# Altium schematic sheet Flash_memory.SchDoc: =DT_SCH_Title
size A3; Organization: Droid Technologies
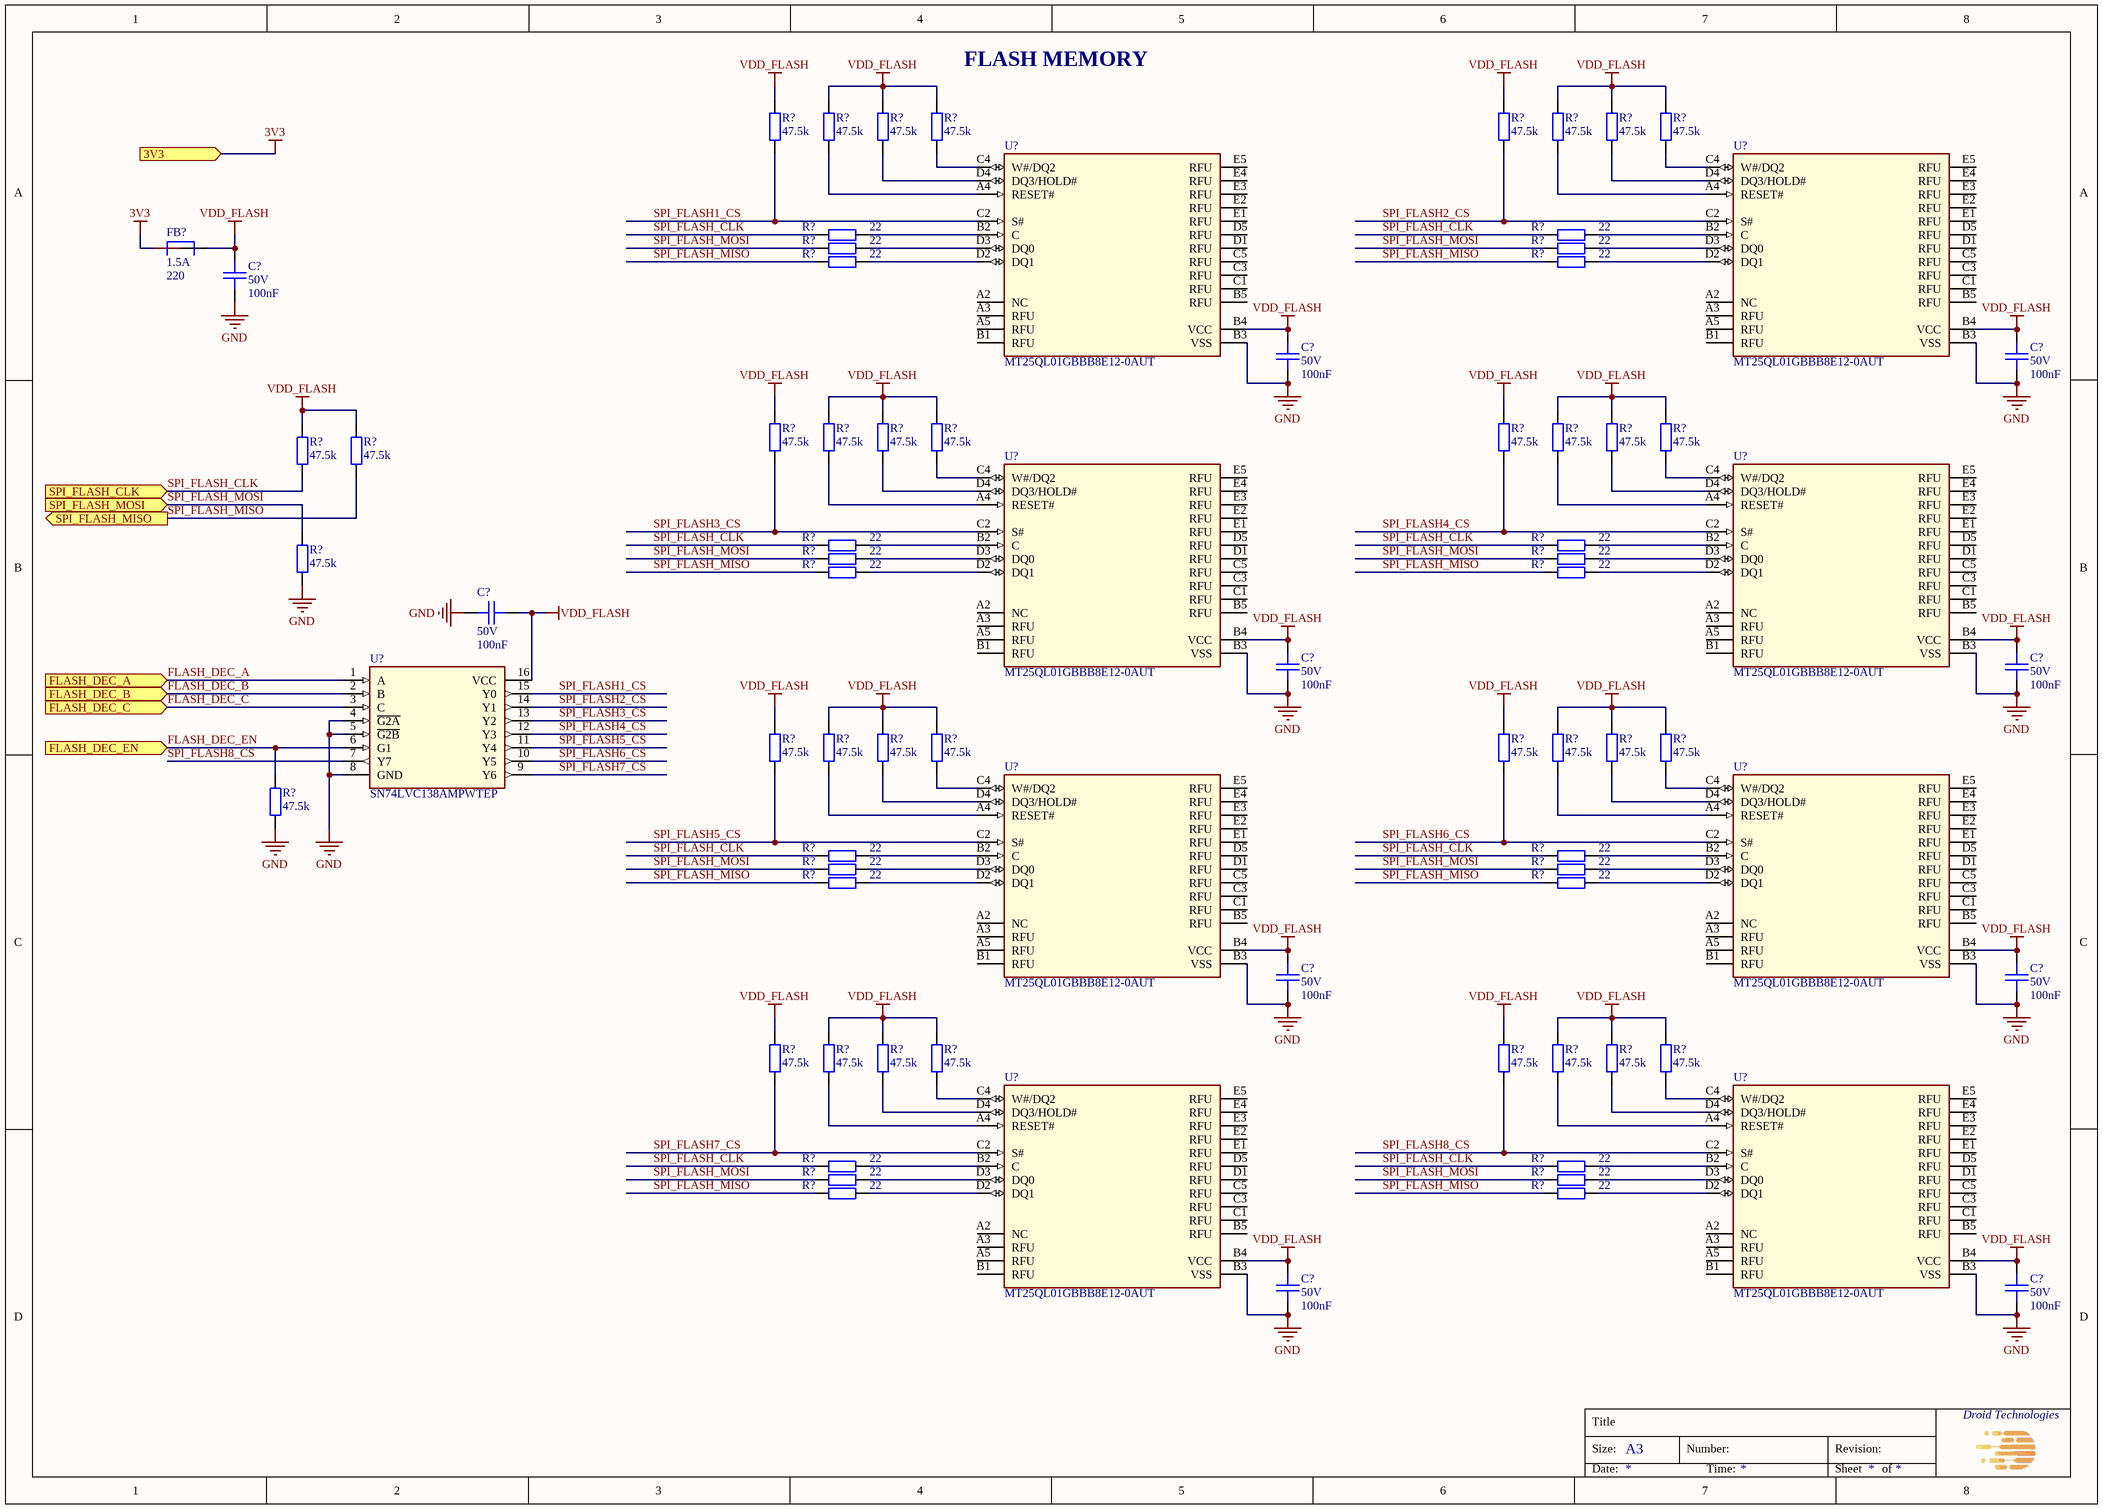
[diagram p0: Flash_memory.SchDoc]

## Parts
(Parts that share a designator on the sheet are numbered #1, #2 ... from top to bottom, then left to right.)
C?#1  Voltage Rating: 50V  Capacitance: 100nF  [CAPC100x50x50L25]  (hidden comment: GCM155L8EH104KE07D)
C?#2  Voltage Rating: 50V  Capacitance: 100nF  [CAPC100x50x50L25]  (hidden comment: GCM155L8EH104KE07D)
C?#3  Voltage Rating: 50V  Capacitance: 100nF  [CAPC100x50x50L25]  (hidden comment: GCM155L8EH104KE07D)
C?#4  Voltage Rating: 50V  Capacitance: 100nF  [CAPC100x50x50L25]  (hidden comment: GCM155L8EH104KE07D)
C?#5  Voltage Rating: 50V  Capacitance: 100nF  [CAPC100x50x50L25]  (hidden comment: GCM155L8EH104KE07D)
C?#6  Voltage Rating: 50V  Capacitance: 100nF  [CAPC100x50x50L25]  (hidden comment: GCM155L8EH104KE07D)
C?#7  Voltage Rating: 50V  Capacitance: 100nF  [CAPC100x50x50L25]  (hidden comment: GCM155L8EH104KE07D)
C?#8  Voltage Rating: 50V  Capacitance: 100nF  [CAPC100x50x50L25]  (hidden comment: GCM155L8EH104KE07D)
C?#9  Voltage Rating: 50V  Capacitance: 100nF  [CAPC100x50x50L25]  (hidden comment: GCM155L8EH104KE07D)
C?#10  Voltage Rating: 50V  Capacitance: 100nF  [CAPC100x50x50L25]  (hidden comment: GCM155L8EH104KE07D)
FB?  Imax: 1.5A  Impedance: 220  [BEADC160X80X95L40]  (hidden comment: BLM18KG221BH1D)
R?#1  Resistance: 47.5k  [RESC100X50X40L25]  (hidden comment: RC0402FR-0747K5L)
R?#2  Resistance: 47.5k  [RESC100X50X40L25]  (hidden comment: RC0402FR-0747K5L)
R?#3  Resistance: 47.5k  [RESC100X50X40L25]  (hidden comment: RC0402FR-0747K5L)
R?#4  Resistance: 47.5k  [RESC100X50X40L25]  (hidden comment: RC0402FR-0747K5L)
R?#5  Resistance: 47.5k  [RESC100X50X40L25]  (hidden comment: RC0402FR-0747K5L)
R?#6  Resistance: 47.5k  [RESC100X50X40L25]  (hidden comment: RC0402FR-0747K5L)
R?#7  Resistance: 47.5k  [RESC100X50X40L25]  (hidden comment: RC0402FR-0747K5L)
R?#8  Resistance: 47.5k  [RESC100X50X40L25]  (hidden comment: RC0402FR-0747K5L)
R?#9  Resistance: 22  [RESC100X50X40L25]  (hidden comment: RC0402FR-0722RL)
R?#10  Resistance: 22  [RESC100X50X40L25]  (hidden comment: RC0402FR-0722RL)
R?#11  Resistance: 22  [RESC100X50X40L25]  (hidden comment: RC0402FR-0722RL)
R?#12  Resistance: 22  [RESC100X50X40L25]  (hidden comment: RC0402FR-0722RL)
R?#13  Resistance: 22  [RESC100X50X40L25]  (hidden comment: RC0402FR-0722RL)
R?#14  Resistance: 22  [RESC100X50X40L25]  (hidden comment: RC0402FR-0722RL)
R?#15  Resistance: 47.5k  [RESC100X50X40L25]  (hidden comment: RC0402FR-0747K5L)
R?#16  Resistance: 47.5k  [RESC100X50X40L25]  (hidden comment: RC0402FR-0747K5L)
R?#17  Resistance: 47.5k  [RESC100X50X40L25]  (hidden comment: RC0402FR-0747K5L)
R?#18  Resistance: 47.5k  [RESC100X50X40L25]  (hidden comment: RC0402FR-0747K5L)
R?#19  Resistance: 47.5k  [RESC100X50X40L25]  (hidden comment: RC0402FR-0747K5L)
R?#20  Resistance: 47.5k  [RESC100X50X40L25]  (hidden comment: RC0402FR-0747K5L)
R?#21  Resistance: 47.5k  [RESC100X50X40L25]  (hidden comment: RC0402FR-0747K5L)
R?#22  Resistance: 47.5k  [RESC100X50X40L25]  (hidden comment: RC0402FR-0747K5L)
R?#23  Resistance: 47.5k  [RESC100X50X40L25]  (hidden comment: RC0402FR-0747K5L)
R?#24  Resistance: 47.5k  [RESC100X50X40L25]  (hidden comment: RC0402FR-0747K5L)
R?#25  Resistance: 22  [RESC100X50X40L25]  (hidden comment: RC0402FR-0722RL)
R?#26  Resistance: 22  [RESC100X50X40L25]  (hidden comment: RC0402FR-0722RL)
R?#27  Resistance: 22  [RESC100X50X40L25]  (hidden comment: RC0402FR-0722RL)
R?#28  Resistance: 22  [RESC100X50X40L25]  (hidden comment: RC0402FR-0722RL)
R?#29  Resistance: 22  [RESC100X50X40L25]  (hidden comment: RC0402FR-0722RL)
R?#30  Resistance: 22  [RESC100X50X40L25]  (hidden comment: RC0402FR-0722RL)
R?#31  Resistance: 47.5k  [RESC100X50X40L25]  (hidden comment: RC0402FR-0747K5L)
R?#32  Resistance: 47.5k  [RESC100X50X40L25]  (hidden comment: RC0402FR-0747K5L)
R?#33  Resistance: 47.5k  [RESC100X50X40L25]  (hidden comment: RC0402FR-0747K5L)
R?#34  Resistance: 47.5k  [RESC100X50X40L25]  (hidden comment: RC0402FR-0747K5L)
R?#35  Resistance: 47.5k  [RESC100X50X40L25]  (hidden comment: RC0402FR-0747K5L)
R?#36  Resistance: 47.5k  [RESC100X50X40L25]  (hidden comment: RC0402FR-0747K5L)
R?#37  Resistance: 47.5k  [RESC100X50X40L25]  (hidden comment: RC0402FR-0747K5L)
R?#38  Resistance: 47.5k  [RESC100X50X40L25]  (hidden comment: RC0402FR-0747K5L)
R?#39  Resistance: 47.5k  [RESC100X50X40L25]  (hidden comment: RC0402FR-0747K5L)
R?#40  Resistance: 47.5k  [RESC100X50X40L25]  (hidden comment: RC0402FR-0747K5L)
R?#41  Resistance: 22  [RESC100X50X40L25]  (hidden comment: RC0402FR-0722RL)
R?#42  Resistance: 22  [RESC100X50X40L25]  (hidden comment: RC0402FR-0722RL)
R?#43  Resistance: 22  [RESC100X50X40L25]  (hidden comment: RC0402FR-0722RL)
R?#44  Resistance: 22  [RESC100X50X40L25]  (hidden comment: RC0402FR-0722RL)
R?#45  Resistance: 22  [RESC100X50X40L25]  (hidden comment: RC0402FR-0722RL)
R?#46  Resistance: 22  [RESC100X50X40L25]  (hidden comment: RC0402FR-0722RL)
R?#47  Resistance: 47.5k  [RESC100X50X40L25]  (hidden comment: RC0402FR-0747K5L)
R?#48  Resistance: 47.5k  [RESC100X50X40L25]  (hidden comment: RC0402FR-0747K5L)
R?#49  Resistance: 47.5k  [RESC100X50X40L25]  (hidden comment: RC0402FR-0747K5L)
R?#50  Resistance: 47.5k  [RESC100X50X40L25]  (hidden comment: RC0402FR-0747K5L)
R?#51  Resistance: 47.5k  [RESC100X50X40L25]  (hidden comment: RC0402FR-0747K5L)
R?#52  Resistance: 47.5k  [RESC100X50X40L25]  (hidden comment: RC0402FR-0747K5L)
R?#53  Resistance: 47.5k  [RESC100X50X40L25]  (hidden comment: RC0402FR-0747K5L)
R?#54  Resistance: 47.5k  [RESC100X50X40L25]  (hidden comment: RC0402FR-0747K5L)
R?#55  Resistance: 22  [RESC100X50X40L25]  (hidden comment: RC0402FR-0722RL)
R?#56  Resistance: 22  [RESC100X50X40L25]  (hidden comment: RC0402FR-0722RL)
R?#57  Resistance: 22  [RESC100X50X40L25]  (hidden comment: RC0402FR-0722RL)
R?#58  Resistance: 22  [RESC100X50X40L25]  (hidden comment: RC0402FR-0722RL)
R?#59  Resistance: 22  [RESC100X50X40L25]  (hidden comment: RC0402FR-0722RL)
R?#60  Resistance: 22  [RESC100X50X40L25]  (hidden comment: RC0402FR-0722RL)
U?#1  MT25QL01GBBB8E12-0AUT  [24-T-PBGA (6x8)]
U?#2  MT25QL01GBBB8E12-0AUT  [24-T-PBGA (6x8)]
U?#3  MT25QL01GBBB8E12-0AUT  [24-T-PBGA (6x8)]
U?#4  MT25QL01GBBB8E12-0AUT  [24-T-PBGA (6x8)]
U?#5  SN74LVC138AMPWTEP  [TSSOP16]
U?#6  MT25QL01GBBB8E12-0AUT  [24-T-PBGA (6x8)]
U?#7  MT25QL01GBBB8E12-0AUT  [24-T-PBGA (6x8)]
U?#8  MT25QL01GBBB8E12-0AUT  [24-T-PBGA (6x8)]
U?#9  MT25QL01GBBB8E12-0AUT  [24-T-PBGA (6x8)]

## Ports
3V3 (in), FLASH_DEC_A (in), FLASH_DEC_B (in), FLASH_DEC_C (in), FLASH_DEC_EN (in), SPI_FLASH_CLK (in), SPI_FLASH_MISO (out), SPI_FLASH_MOSI (in)

## Nets
3V3: FB?.1 ; port 3V3
GND: C?#1.1 C?#2.1 C?#3.1 C?#4.1 C?#5.1 C?#6.1 C?#7.1 C?#8.1 C?#9.1 C?#10.1 R?#31.1 R?#40.1 U?#1.B3(VSS) U?#2.B3(VSS) U?#3.B3(VSS) U?#4.B3(VSS) U?#5.4(~{G2A}) U?#5.5(~{G2B}) U?#5.8(GND) U?#6.B3(VSS) U?#7.B3(VSS) U?#8.B3(VSS) U?#9.B3(VSS)
VDD_FLASH: C?#1.2 C?#2.2 C?#3.2 C?#4.2 C?#5.2 C?#6.2 C?#7.2 C?#8.2 C?#9.2 C?#10.2 FB?.2 R?#1.2 R?#2.2 R?#3.2 R?#4.2 R?#5.2 R?#6.2 R?#7.2 R?#8.2 R?#15.2 R?#16.2 R?#17.2 R?#18.2 R?#19.2 R?#20.2 R?#21.2 R?#22.2 R?#23.2 R?#24.2 R?#32.2 R?#33.2 R?#34.2 R?#35.2 R?#36.2 R?#37.2 R?#38.2 R?#39.2 R?#47.2 R?#48.2 R?#49.2 R?#50.2 R?#51.2 R?#52.2 R?#53.2 R?#54.2 U?#1.B4(VCC) U?#2.B4(VCC) U?#3.B4(VCC) U?#4.B4(VCC) U?#5.16(VCC) U?#6.B4(VCC) U?#7.B4(VCC) U?#8.B4(VCC) U?#9.B4(VCC)
FLASH_DEC_A: U?#5.1(A) ; port FLASH_DEC_A
FLASH_DEC_B: U?#5.2(B) ; port FLASH_DEC_B
FLASH_DEC_C: U?#5.3(C) ; port FLASH_DEC_C
FLASH_DEC_EN: R?#40.2 U?#5.6(G1) ; port FLASH_DEC_EN
SPI_FLASH1_CS: R?#1.1 U?#1.C2(S#) U?#5.15(Y0)
SPI_FLASH2_CS: R?#5.1 U?#2.C2(S#) U?#5.14(Y1)
SPI_FLASH3_CS: R?#15.1 U?#3.C2(S#) U?#5.13(Y2)
SPI_FLASH4_CS: R?#19.1 U?#4.C2(S#) U?#5.12(Y3)
SPI_FLASH5_CS: R?#32.1 U?#5.11(Y4) U?#6.C2(S#)
SPI_FLASH6_CS: R?#36.1 U?#5.10(Y5) U?#7.C2(S#)
SPI_FLASH7_CS: R?#47.1 U?#5.9(Y6) U?#8.C2(S#)
SPI_FLASH8_CS: R?#51.1 U?#5.7(Y7) U?#9.C2(S#)
SPI_FLASH_CLK: R?#9.1 R?#10.1 R?#23.1 R?#25.1 R?#26.1 R?#41.1 R?#42.1 R?#55.1 R?#56.1 ; port SPI_FLASH_CLK
SPI_FLASH_MISO: R?#13.1 R?#14.1 R?#24.1 R?#29.1 R?#30.1 R?#45.1 R?#46.1 R?#59.1 R?#60.1 ; port SPI_FLASH_MISO
SPI_FLASH_MOSI: R?#11.1 R?#12.1 R?#27.1 R?#28.1 R?#31.2 R?#43.1 R?#44.1 R?#57.1 R?#58.1 ; port SPI_FLASH_MOSI
NetR?#2_1: R?#2.1 U?#1.A4(RESET#)
NetR?#3_1: R?#3.1 U?#1.D4(DQ3/HOLD#)
NetR?#4_1: R?#4.1 U?#1.C4(W#/DQ2)
NetR?#6_1: R?#6.1 U?#2.A4(RESET#)
NetR?#7_1: R?#7.1 U?#2.D4(DQ3/HOLD#)
NetR?#8_1: R?#8.1 U?#2.C4(W#/DQ2)
NetR?#9_2: R?#9.2 U?#1.B2(C)
NetR?#10_2: R?#10.2 U?#2.B2(C)
NetR?#11_2: R?#11.2 U?#1.D3(DQ0)
NetR?#12_2: R?#12.2 U?#2.D3(DQ0)
NetR?#13_2: R?#13.2 U?#1.D2(DQ1)
NetR?#14_2: R?#14.2 U?#2.D2(DQ1)
NetR?#16_1: R?#16.1 U?#3.A4(RESET#)
NetR?#17_1: R?#17.1 U?#3.D4(DQ3/HOLD#)
NetR?#18_1: R?#18.1 U?#3.C4(W#/DQ2)
NetR?#20_1: R?#20.1 U?#4.A4(RESET#)
NetR?#21_1: R?#21.1 U?#4.D4(DQ3/HOLD#)
NetR?#22_1: R?#22.1 U?#4.C4(W#/DQ2)
NetR?#25_2: R?#25.2 U?#3.B2(C)
NetR?#26_2: R?#26.2 U?#4.B2(C)
NetR?#27_2: R?#27.2 U?#3.D3(DQ0)
NetR?#28_2: R?#28.2 U?#4.D3(DQ0)
NetR?#29_2: R?#29.2 U?#3.D2(DQ1)
NetR?#30_2: R?#30.2 U?#4.D2(DQ1)
NetR?#33_1: R?#33.1 U?#6.A4(RESET#)
NetR?#34_1: R?#34.1 U?#6.D4(DQ3/HOLD#)
NetR?#35_1: R?#35.1 U?#6.C4(W#/DQ2)
NetR?#37_1: R?#37.1 U?#7.A4(RESET#)
NetR?#38_1: R?#38.1 U?#7.D4(DQ3/HOLD#)
NetR?#39_1: R?#39.1 U?#7.C4(W#/DQ2)
NetR?#41_2: R?#41.2 U?#6.B2(C)
NetR?#42_2: R?#42.2 U?#7.B2(C)
NetR?#43_2: R?#43.2 U?#6.D3(DQ0)
NetR?#44_2: R?#44.2 U?#7.D3(DQ0)
NetR?#45_2: R?#45.2 U?#6.D2(DQ1)
NetR?#46_2: R?#46.2 U?#7.D2(DQ1)
NetR?#48_1: R?#48.1 U?#8.A4(RESET#)
NetR?#49_1: R?#49.1 U?#8.D4(DQ3/HOLD#)
NetR?#50_1: R?#50.1 U?#8.C4(W#/DQ2)
NetR?#52_1: R?#52.1 U?#9.A4(RESET#)
NetR?#53_1: R?#53.1 U?#9.D4(DQ3/HOLD#)
NetR?#54_1: R?#54.1 U?#9.C4(W#/DQ2)
NetR?#55_2: R?#55.2 U?#8.B2(C)
NetR?#56_2: R?#56.2 U?#9.B2(C)
NetR?#57_2: R?#57.2 U?#8.D3(DQ0)
NetR?#58_2: R?#58.2 U?#9.D3(DQ0)
NetR?#59_2: R?#59.2 U?#8.D2(DQ1)
NetR?#60_2: R?#60.2 U?#9.D2(DQ1)

Not connected (* = marked no-connect by the designer): U?#1 A2(NC) A3(RFU) A5(RFU) B1(RFU) B5(RFU) C1(RFU) C3(RFU) C5(RFU) D1(RFU) D5(RFU) E1(RFU) E2(RFU) E3(RFU) E4(RFU) E5(RFU); U?#2 A2(NC) A3(RFU) A5(RFU) B1(RFU) B5(RFU) C1(RFU) C3(RFU) C5(RFU) D1(RFU) D5(RFU) E1(RFU) E2(RFU) E3(RFU) E4(RFU) E5(RFU); U?#3 A2(NC) A3(RFU) A5(RFU) B1(RFU) B5(RFU) C1(RFU) C3(RFU) C5(RFU) D1(RFU) D5(RFU) E1(RFU) E2(RFU) E3(RFU) E4(RFU) E5(RFU); U?#4 A2(NC) A3(RFU) A5(RFU) B1(RFU) B5(RFU) C1(RFU) C3(RFU) C5(RFU) D1(RFU) D5(RFU) E1(RFU) E2(RFU) E3(RFU) E4(RFU) E5(RFU); U?#6 A2(NC) A3(RFU) A5(RFU) B1(RFU) B5(RFU) C1(RFU) C3(RFU) C5(RFU) D1(RFU) D5(RFU) E1(RFU) E2(RFU) E3(RFU) E4(RFU) E5(RFU); U?#7 A2(NC) A3(RFU) A5(RFU) B1(RFU) B5(RFU) C1(RFU) C3(RFU) C5(RFU) D1(RFU) D5(RFU) E1(RFU) E2(RFU) E3(RFU) E4(RFU) E5(RFU); U?#8 A2(NC) A3(RFU) A5(RFU) B1(RFU) B5(RFU) C1(RFU) C3(RFU) C5(RFU) D1(RFU) D5(RFU) E1(RFU) E2(RFU) E3(RFU) E4(RFU) E5(RFU); U?#9 A2(NC) A3(RFU) A5(RFU) B1(RFU) B5(RFU) C1(RFU) C3(RFU) C5(RFU) D1(RFU) D5(RFU) E1(RFU) E2(RFU) E3(RFU) E4(RFU) E5(RFU)

## Notes on the sheet
- (near R?#4) FLASH MEMORY
- Title
- Size:
- A3
- Number:
- Revision:
- Date:
- Time:
- Sheet
- of

## Library data of the parts
C?#1-C?#10 = CMP-001-1980-1: CAP CER 0.1UF 50V X8L 0402; Manufacturer: Murata Electronics; Op Temp max: 150°C; Op Temp min: -55°C; Tolerance: 10%; Height max: 550µm; ComponentLink3Description: Digikey; Mounting Type: SM; ComponentLink3URL: https://www.digikey.com/en/products/detail/murata-electronics/GCM155L8EH104KE07D/11618823; Package: 0402 (1005 Metric); Lead Spacing: 0mm; MPN: GCM155L8EH104KE07D; Size: 1.00mm x 0.50mm; Ratings: AEC-Q200; ComponentLink1URL: https://search.murata.co.jp/Ceramy/image/img/A01X/G101/ENG/GCM155L8EH104KE07-01.pdf; ComponentLink1Description: Datasheet; Dielectric: X8L; ComponentLink2Description: Mouser; ComponentLink2URL: https://eu.mouser.com/ProductDetail/Murata-Electronics/GCM155L8EH104KE07D?qs=1mbolxNpo8fQSHf0HYnZWw%3D%3D
FB? = CMP-001-1981-1: FERRITE BEAD 220 OHM 0603 1LN; Manufacturer: Murata Electronics; DCR: 50m; Op Temp min: -55°C; Frequency: 100MHz; Op Temp max: 150°C; Number of Lines: 1; Mounting Type: SM; Size: 1.60mm x 0.80mm; ComponentLink2URL: https://eu.mouser.com/ProductDetail/Murata-Electronics/BLM18KG221BH1D?qs=sJ5gq5MLFXpgEHYBdWUtkQ%3D%3D; ComponentLink1Description: Datasheet; ComponentLink1URL: https://www.murata.com/en-us/products/productdata/8798137286686/QNFA9129.pdf; Lead Spacing: 0mm; Ratings: AEC-Q200; ComponentLink3Description: Digikey; ComponentLink3URL: https://www.digikey.com/en/products/detail/murata-electronics/BLM18KG221BH1D/6156000; Height max: 950µm; Package: 0603 (1608 Metric); ComponentLink2Description: Mouser; MPN: BLM18KG221BH1D
R?#1-R?#8 R?#15-R?#24 R?#31-R?#40 R?#47-R?#54 = CMP-001-0277-7: RES 47.5K OHM 1% 1/16W 0402; Manufacturer: YAGEO; Op Temp min: -55°C; Power: 63mW; Temperature Coefficient: ±100ppm; Op Temp max: 155°C; ComponentLink1URL: https://www.yageo.com/upload/media/product/productsearch/datasheet/rchip/PYu-RC_Group_51_RoHS_L_12.pdf; ComponentLink1Description: Datasheet; MPN: RC0402FR-0747K5L; ComponentLink3Description: Digikey; ComponentLink2URL: https://eu.mouser.com/ProductDetail/YAGEO/RC0402FR-0747K5L?qs=V1yeUXFNrklfu86Rfgihxg%3D%3D; Mounting Type: SM; Tolerance: 1%; Package: 0402 (1005 Metric); Height max: 400µm; ComponentLink2Description: Mouser; ComponentLink3URL: https://www.digikey.com/en/products/detail/yageo/RC0402FR-0747K5L/726617; Size: 1.00mm x 0.50mm; Composition: Thick Film; Ratings: -
R?#9-R?#14 R?#25-R?#30 R?#41-R?#46 R?#55-R?#60 = CMP-001-0482-4: RES 22 OHM 1% 1/16W 0402; Manufacturer: YAGEO; Temperature Coefficient: ±100ppm; Op Temp max: 155°C; Op Temp min: -55°C; Power: 63mW; Ratings: -; ComponentLink3URL: https://www.digikey.com/en/products/detail/yageo/RC0402FR-0722RL/726562; ComponentLink2URL: https://eu.mouser.com/ProductDetail/YAGEO/RC0402FR-0722RL?qs=V1yeUXFNrkkRg6zf08ADKQ%3D%3D; MPN: RC0402FR-0722RL; ComponentLink1Description: Datasheet; ComponentLink3Description: Digikey; Tolerance: 1%; Size: 1.00mm x 0.50mm; ComponentLink1URL: https://www.yageo.com/upload/media/product/productsearch/datasheet/rchip/PYu-RC_Group_51_RoHS_L_12.pdf; Composition: Thick Film; ComponentLink2Description: Mouser; Mounting Type: SM; Package: 0402 (1005 Metric); Height max: 400µm
U?#1-U?#4 U?#6-U?#9 = MT25QL01GBBB8E12-0AUT: IC FLASH 1GBIT SPI 24TPBGA; Manufacturer: Micron Technology Inc.; MPN: MT25QL01GBBB8E12-0AUT
U?#5 = SN74LVC138AMPWTEP: IC DECODER/DEMUX 1X3:8 16-TSSOP; Manufacturer: Texas Instruments; MPN: SN74LVC138AMPWTEP